# Altium schematic sheet Top_Sheet.SchDoc
size 420 x 297 mm; SheetNumber: 1; SheetTotal: 27
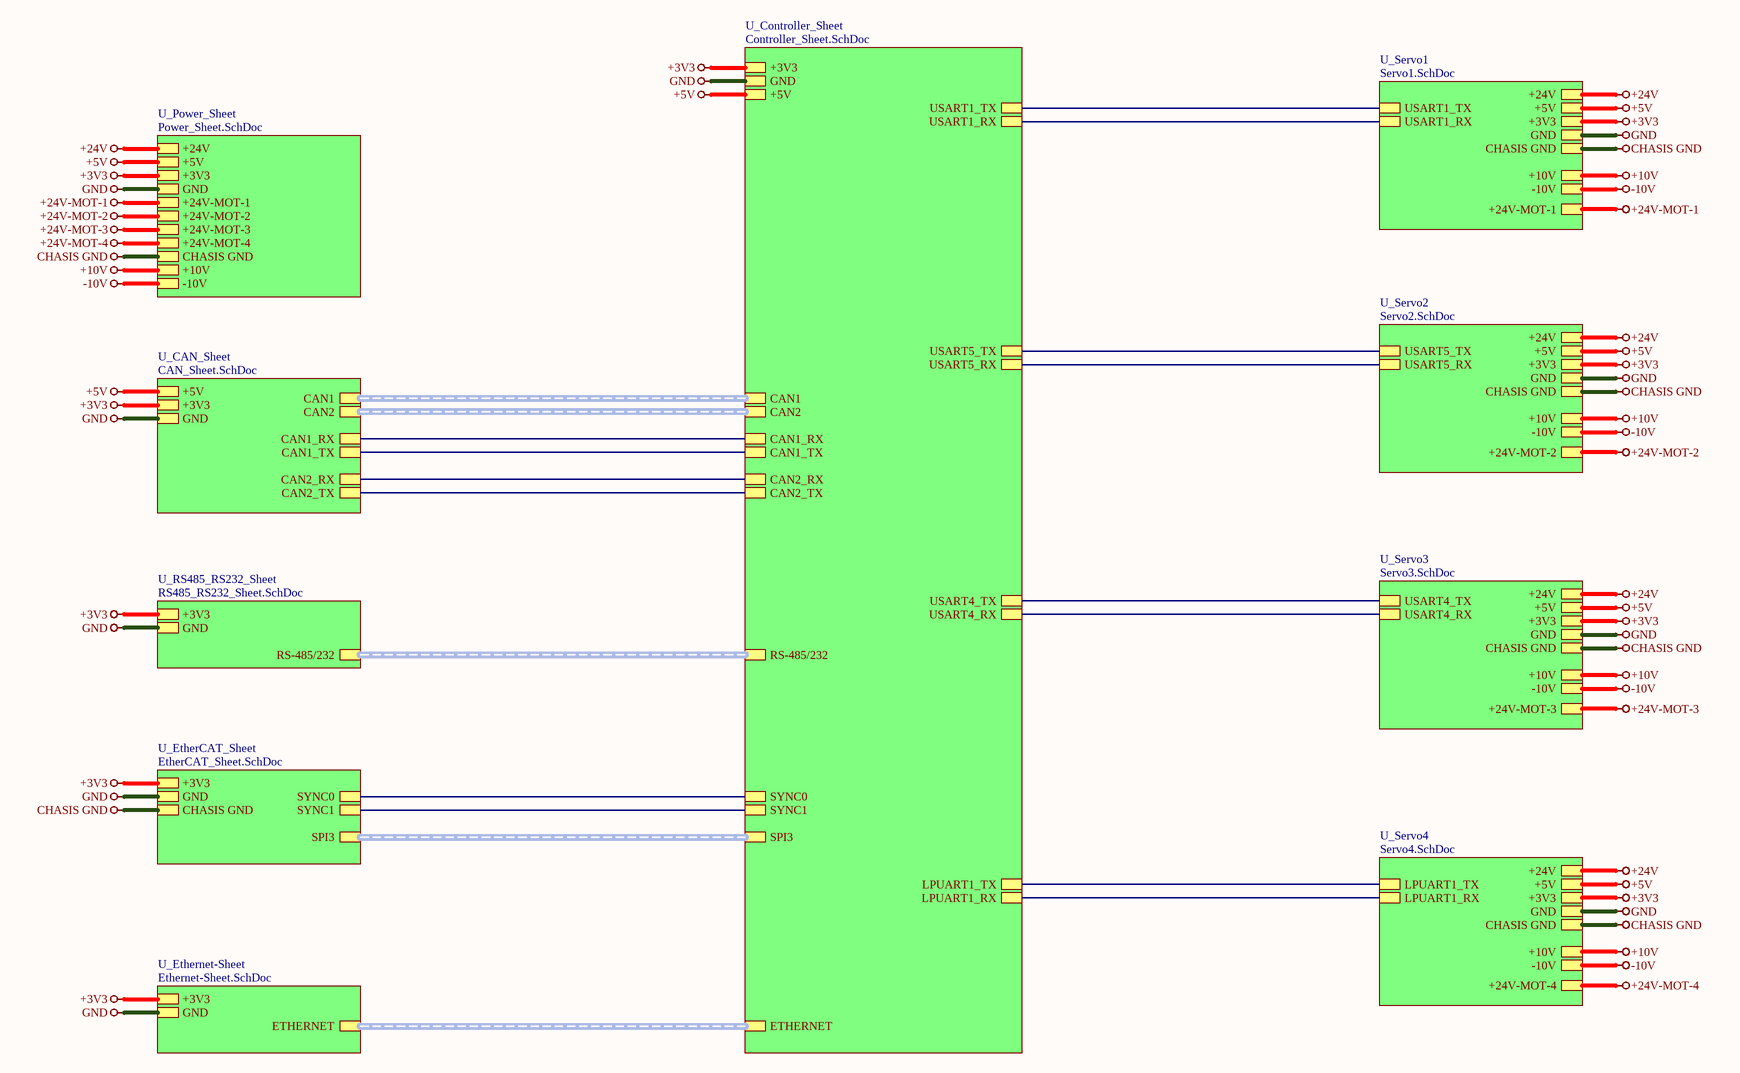
[diagram p0: Top_Sheet.SchDoc]

## Sub-sheets
U_CAN_Sheet = CAN_Sheet.SchDoc: CAN1 (harness CAN1), CAN2_RX, CAN2_TX, +5V, +3V3, GND, CAN1_RX, CAN1_TX, CAN2 (harness CAN2)
U_Controller_Sheet = Controller_Sheet.SchDoc: RS-485/232 (harness RS-485/232), +3V3, GND, USART4_RX, USART4_TX, SYNC0, SYNC1, USART5_TX, USART5_RX, CAN1 (harness CAN1), CAN2_RX, CAN2_TX, +5V, CAN1_RX, CAN1_TX, CAN2 (harness CAN2), SPI3 (harness SPI3), USART1_TX, USART1_RX, LPUART1_TX, LPUART1_RX, ETHERNET (harness SPI3)
U_EtherCAT_Sheet = EtherCAT_Sheet.SchDoc: +3V3, GND, SPI3 (harness SPI3), CHASIS GND, SYNC0, SYNC1
U_Ethernet-Sheet = Ethernet-Sheet.SchDoc: +3V3, GND, ETHERNET (harness ETHERNET)
U_Power_Sheet = Power_Sheet.SchDoc: +24V, +5V, +3V3, GND, +24V-MOT-1, +24V-MOT-2, +24V-MOT-3, +24V-MOT-4, CHASIS GND, +10V, -10V
U_RS485_RS232_Sheet = RS485_RS232_Sheet.SchDoc: RS-485/232 (harness RS-485/232), +3V3, GND
U_Servo1 = Servo1.SchDoc: +24V, +5V, GND, +3V3, CHASIS GND, +24V-MOT-1, USART1_TX, USART1_RX, +10V, -10V
U_Servo2 = Servo2.SchDoc: +24V-MOT-2, USART5_TX, USART5_RX, +24V, +5V, GND, +3V3, CHASIS GND, +10V, -10V
U_Servo3 = Servo3.SchDoc: +24V-MOT-3, USART4_TX, USART4_RX, +24V, +5V, GND, +3V3, CHASIS GND, +10V, -10V
U_Servo4 = Servo4.SchDoc: +24V-MOT-4, LPUART1_TX, LPUART1_RX, +24V, +5V, GND, +3V3, CHASIS GND, +10V, -10V

## Nets
+3V3: sheet U_Controller_Sheet/+3V3, sheet U_CAN_Sheet/+3V3, sheet U_RS485_RS232_Sheet/+3V3, sheet U_EtherCAT_Sheet/+3V3, sheet U_Servo3/+3V3, sheet U_Servo4/+3V3, sheet U_Power_Sheet/+3V3, sheet U_Servo1/+3V3, sheet U_Servo2/+3V3, sheet U_Ethernet-Sheet/+3V3
+5V: sheet U_Controller_Sheet/+5V, sheet U_CAN_Sheet/+5V, sheet U_Servo3/+5V, sheet U_Servo4/+5V, sheet U_Power_Sheet/+5V, sheet U_Servo1/+5V, sheet U_Servo2/+5V
+10V: sheet U_Servo3/+10V, sheet U_Servo4/+10V, sheet U_Power_Sheet/+10V, sheet U_Servo1/+10V, sheet U_Servo2/+10V
+24V: sheet U_Servo3/+24V, sheet U_Servo4/+24V, sheet U_Power_Sheet/+24V, sheet U_Servo1/+24V, sheet U_Servo2/+24V
+24V-MOT-1: sheet U_Power_Sheet/+24V-MOT-1, sheet U_Servo1/+24V-MOT-1
+24V-MOT-2: sheet U_Power_Sheet/+24V-MOT-2, sheet U_Servo2/+24V-MOT-2
+24V-MOT-3: sheet U_Servo3/+24V-MOT-3, sheet U_Power_Sheet/+24V-MOT-3
+24V-MOT-4: sheet U_Servo4/+24V-MOT-4, sheet U_Power_Sheet/+24V-MOT-4
-10V: sheet U_Servo3/-10V, sheet U_Servo4/-10V, sheet U_Power_Sheet/-10V, sheet U_Servo1/-10V, sheet U_Servo2/-10V
CHASIS GND: sheet U_EtherCAT_Sheet/CHASIS GND, sheet U_Servo3/CHASIS GND, sheet U_Servo4/CHASIS GND, sheet U_Power_Sheet/CHASIS GND, sheet U_Servo1/CHASIS GND, sheet U_Servo2/CHASIS GND
GND: sheet U_Controller_Sheet/GND, sheet U_CAN_Sheet/GND, sheet U_RS485_RS232_Sheet/GND, sheet U_EtherCAT_Sheet/GND, sheet U_Servo3/GND, sheet U_Servo4/GND, sheet U_Power_Sheet/GND, sheet U_Servo1/GND, sheet U_Servo2/GND, sheet U_Ethernet-Sheet/GND
(unnamed): sheet U_Controller_Sheet/USART4_RX, sheet U_Servo3/USART4_RX
(unnamed): sheet U_Controller_Sheet/USART4_TX, sheet U_Servo3/USART4_TX
(unnamed): sheet U_Controller_Sheet/SYNC0, sheet U_EtherCAT_Sheet/SYNC0
(unnamed): sheet U_Controller_Sheet/SYNC1, sheet U_EtherCAT_Sheet/SYNC1
(unnamed): sheet U_Controller_Sheet/USART5_TX, sheet U_Servo2/USART5_TX
(unnamed): sheet U_Controller_Sheet/USART5_RX, sheet U_Servo2/USART5_RX
(unnamed): sheet U_Controller_Sheet/CAN2_RX, sheet U_CAN_Sheet/CAN2_RX
(unnamed): sheet U_Controller_Sheet/CAN2_TX, sheet U_CAN_Sheet/CAN2_TX
(unnamed): sheet U_Controller_Sheet/CAN1_RX, sheet U_CAN_Sheet/CAN1_RX
(unnamed): sheet U_Controller_Sheet/CAN1_TX, sheet U_CAN_Sheet/CAN1_TX
(unnamed): sheet U_Controller_Sheet/USART1_TX, sheet U_Servo1/USART1_TX
(unnamed): sheet U_Controller_Sheet/USART1_RX, sheet U_Servo1/USART1_RX
(unnamed): sheet U_Controller_Sheet/LPUART1_TX, sheet U_Servo4/LPUART1_TX
(unnamed): sheet U_Controller_Sheet/LPUART1_RX, sheet U_Servo4/LPUART1_RX

## Buses and harness runs
harness sheet U_CAN_Sheet/CAN1 = sheet U_Controller_Sheet/CAN1
harness sheet U_CAN_Sheet/CAN2 = sheet U_Controller_Sheet/CAN2
harness sheet U_Controller_Sheet/ETHERNET = sheet U_Ethernet-Sheet/ETHERNET
harness sheet U_Controller_Sheet/RS-485/232 = sheet U_RS485_RS232_Sheet/RS-485/232
harness sheet U_Controller_Sheet/SPI3 = sheet U_EtherCAT_Sheet/SPI3

## Notes on the sheet
- File:
- Title:
- Date:
- Page
- Num:
- Total:
- Drawn By: Huzaifa Ali